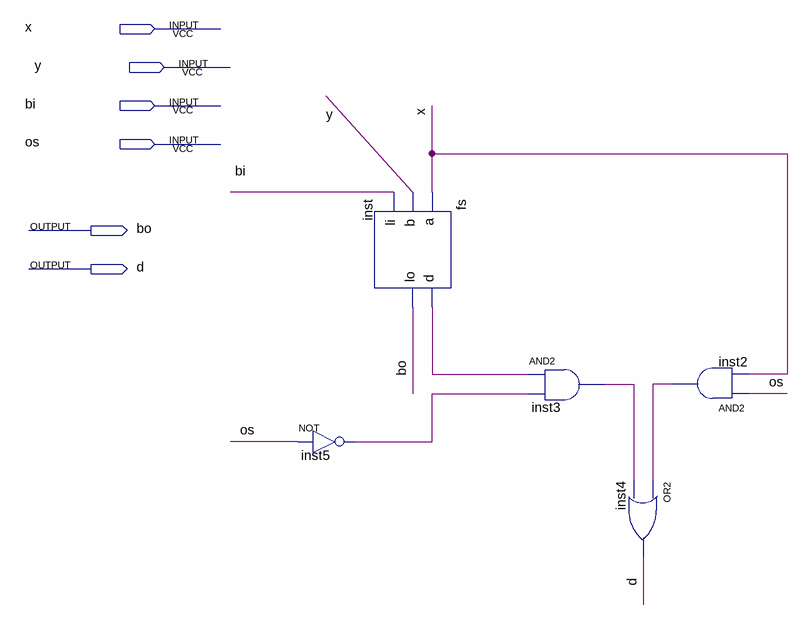
[diagram p0: schematic sheet]
// Quartus schematic csm.bdf as structural Verilog: 5 symbols, 6 pins
module csm (
  input  x,
  input  y,
  input  bi,
  input  os,
  output bo,
  output d
);

  wire inst2_out, inst3_out, inst5_out, inst_d;

  not inst5 (inst5_out, os);
  fs inst (.a(x), .b(y), .li(bi), .d(inst_d), .lo(bo));
  and inst3 (inst3_out, inst_d, inst5_out);
  or inst4 (d, inst2_out, inst3_out);
  and inst2 (inst2_out, os, x);
endmodule
